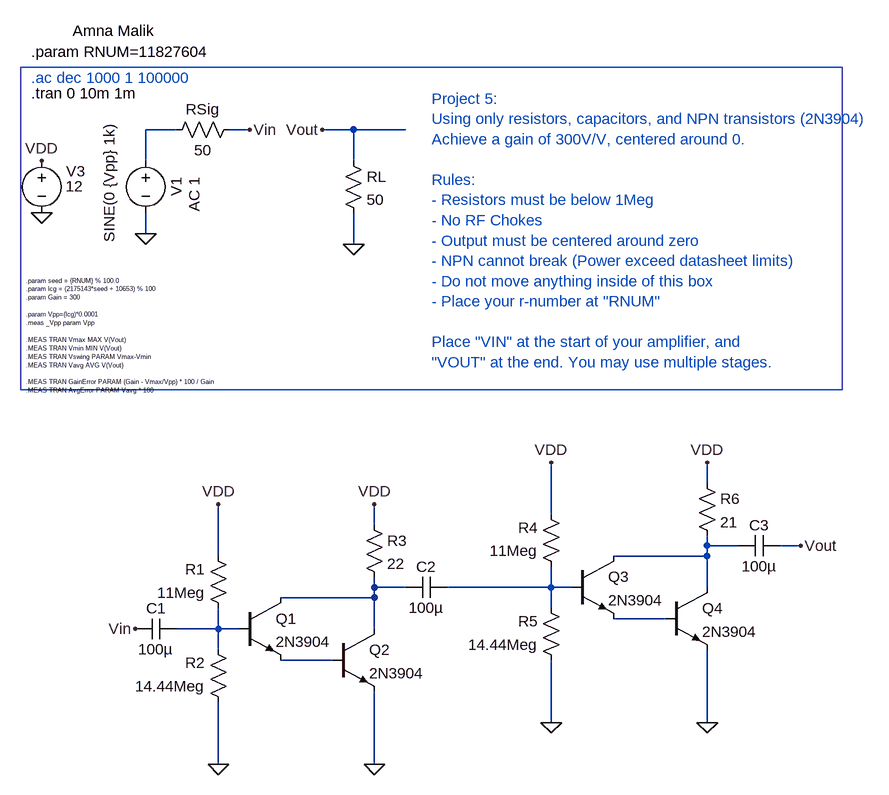
[diagram p0: schematic Project 5 Assignment-1.asc]
Project 5 Assignment-1.asc, the LTspice schematic file:
Version 4.1
SHEET 1 1304 1140
WIRE -336 144 -384 144
WIRE -224 144 -256 144
WIRE -64 144 -112 144
WIRE 16 144 -64 144
WIRE -384 192 -384 144
WIRE -64 192 -64 144
WIRE -384 304 -384 272
WIRE -64 320 -64 272
WIRE 480 688 480 656
WIRE 240 736 240 656
WIRE -32 752 -32 720
WIRE 480 784 480 768
WIRE 528 784 480 784
WIRE 624 784 592 784
WIRE -272 800 -272 720
WIRE 480 800 480 784
WIRE 480 800 336 800
WIRE -32 848 -32 832
WIRE 16 848 -32 848
WIRE 240 848 240 816
WIRE 240 848 80 848
WIRE 272 848 240 848
WIRE 480 848 480 800
WIRE -32 864 -32 848
WIRE -32 864 -176 864
WIRE 240 880 240 848
WIRE 416 896 336 896
WIRE -272 912 -272 880
WIRE -272 912 -336 912
WIRE -240 912 -272 912
WIRE -32 912 -32 864
WIRE -272 944 -272 912
WIRE -96 960 -176 960
WIRE 240 1056 240 960
WIRE 480 1056 480 944
WIRE -272 1120 -272 1024
WIRE -32 1120 -32 1008
FLAG -384 304 0
FLAG -64 320 0
FLAG -544 272 0
FLAG -544 192 VDD
FLAG -224 144 Vin
FLAG -112 144 Vout
FLAG -272 720 VDD
FLAG -272 1120 0
FLAG -32 720 VDD
FLAG -400 912 Vin
FLAG -32 1120 0
FLAG 240 656 VDD
FLAG 240 1056 0
FLAG 480 656 VDD
FLAG 480 1056 0
FLAG 624 784 Vout
SYMBOL voltage -384 176 R0
WINDOW 3 -56 -42 VRight 2
WINDOW 123 75 41 VRight 2
WINDOW 39 0 0 Left 0
WINDOW 0 47 41 VRight 2
SYMATTR Value SINE(0 {Vpp} 1k)
SYMATTR Value2 AC 1
SYMATTR InstName V1
SYMBOL res -80 176 R0
SYMATTR InstName RL
SYMATTR Value 50
SYMBOL res -240 128 R90
WINDOW 0 0 56 VBottom 2
WINDOW 3 32 56 VTop 2
SYMATTR InstName RSig
SYMATTR Value 50
SYMBOL voltage -544 176 R0
WINDOW 3 37 55 Left 2
WINDOW 123 0 0 Left 0
WINDOW 39 0 0 Left 0
WINDOW 0 38 32 Left 2
SYMATTR Value 12
SYMATTR InstName V3
SYMBOL npn -240 864 R0
SYMATTR InstName Q1
SYMATTR Value 2N3904
SYMBOL res -256 896 R180
WINDOW 0 36 76 Left 2
WINDOW 3 36 40 Left 2
SYMATTR InstName R1
SYMATTR Value 11Meg
SYMBOL res -256 1040 R180
WINDOW 0 36 76 Left 2
WINDOW 3 36 40 Left 2
SYMATTR InstName R2
SYMATTR Value 14.44Meg
SYMBOL cap -336 896 R90
WINDOW 0 0 32 VBottom 2
WINDOW 3 32 32 VTop 2
SYMATTR InstName C1
SYMATTR Value 100µ
SYMBOL res -48 736 R0
SYMATTR InstName R3
SYMATTR Value 22
SYMBOL npn -96 912 R0
SYMATTR InstName Q2
SYMATTR Value 2N3904
SYMBOL cap 80 832 R90
WINDOW 0 0 32 VBottom 2
WINDOW 3 32 32 VTop 2
SYMATTR InstName C2
SYMATTR Value 100µ
SYMBOL npn 272 800 R0
SYMATTR InstName Q3
SYMATTR Value 2N3904
SYMBOL res 256 832 R180
WINDOW 0 36 76 Left 2
WINDOW 3 36 40 Left 2
SYMATTR InstName R4
SYMATTR Value 11Meg
SYMBOL res 256 976 R180
WINDOW 0 36 76 Left 2
WINDOW 3 36 40 Left 2
SYMATTR InstName R5
SYMATTR Value 14.44Meg
SYMBOL res 464 672 R0
SYMATTR InstName R6
SYMATTR Value 21
SYMBOL npn 416 848 R0
SYMATTR InstName Q4
SYMATTR Value 2N3904
SYMBOL cap 592 768 R90
WINDOW 0 0 32 VBottom 2
WINDOW 3 32 32 VTop 2
SYMATTR InstName C3
SYMATTR Value 100µ
TEXT -560 88 Left 2 !.tran 0 10m 1m
TEXT -560 64 Left 2 ;.ac dec 1000 1 100000
TEXT -560 24 Left 2 !.param RNUM=11827604
TEXT -568 376 Left 0 !.param seed = {RNUM} % 100.0\n.param lcg = (2175143*seed + 10653) % 100\n.param Gain = 300\n \n.param Vpp=(lcg)*0.0001\n.meas _Vpp param Vpp\n \n.MEAS TRAN Vmax MAX V(Vout)\n.MEAS TRAN Vmin MIN V(Vout)\n.MEAS TRAN Vswing PARAM Vmax-Vmin\n.MEAS TRAN Vavg AVG V(Vout)\n \n.MEAS TRAN GainError PARAM (Gain - Vmax/Vpp) * 100 / Gain\n.MEAS TRAN AvgError PARAM Vavg * 100
TEXT 56 96 Left 2 ;Project 5:\nUsing only resistors, capacitors, and NPN transistors (2N3904)\nAchieve a gain of 300V/V, centered around 0.\n \nRules:\n- Resistors must be below 1Meg\n- No RF Chokes\n- Output must be centered around zero\n- NPN cannot break (Power exceed datasheet limits)\n- Do not move anything inside of this box\n- Place your r-number at "RNUM"\n \nPlace "VIN" at the start of your amplifier, and\n"VOUT" at the end. You may use multiple stages.
TEXT -496 -8 Left 2 !Amna Malik
RECTANGLE Normal 688 544 -576 48

The netlist it stands for:
* Project 5 Assignment-1.asc
V1 N001 0 SINE(0 {Vpp} 1k) AC 1
RL Vout 0 50
RSig Vin N001 50
V3 VDD 0 12
Q1 N003 N006 N007 0 2N3904
R1 N006 VDD 11Meg
R2 0 N006 14.44Meg
C1 N006 Vin 100µ
R3 VDD N003 22
Q2 N003 N007 0 0 2N3904
C2 N004 N003 100µ
Q3 N002 N004 N005 0 2N3904
R4 N004 VDD 11Meg
R5 0 N004 14.44Meg
R6 VDD N002 21
Q4 N002 N005 0 0 2N3904
C3 Vout N002 100µ
.model NPN NPN
.model PNP PNP
.lib standard.bjt
.tran 0 10m 1m
* .ac dec 1000 1 100000
.param RNUM=11827604
.param seed = {RNUM} % 100.0
.param lcg = (2175143*seed + 10653) % 100
.param Gain = 300
.param Vpp=(lcg)*0.0001
.meas _Vpp param Vpp
.MEAS TRAN Vmax MAX V(Vout)
.MEAS TRAN Vmin MIN V(Vout)
.MEAS TRAN Vswing PARAM Vmax-Vmin
.MEAS TRAN Vavg AVG V(Vout)
.MEAS TRAN GainError PARAM (Gain - Vmax/Vpp) * 100 / Gain
.MEAS TRAN AvgError PARAM Vavg * 100
* Project 5:
* Using only resistors, capacitors, and NPN transistors (2N3904)
* Achieve a gain of 300V/V, centered around 0.
* Rules:
* - Resistors must be below 1Meg
* - No RF Chokes
* - Output must be centered around zero
* - NPN cannot break (Power exceed datasheet limits)
* - Do not move anything inside of this box
* - Place your r-number at "RNUM"
* Place "VIN" at the start of your amplifier, and
* "VOUT" at the end. You may use multiple stages.
Amna Malik
.backanno
.end